# Altium schematic sheet Main_Cont_2.SchDoc
size A4; DocumentNumber: 16; SheetNumber: 16; SheetTotal: 28
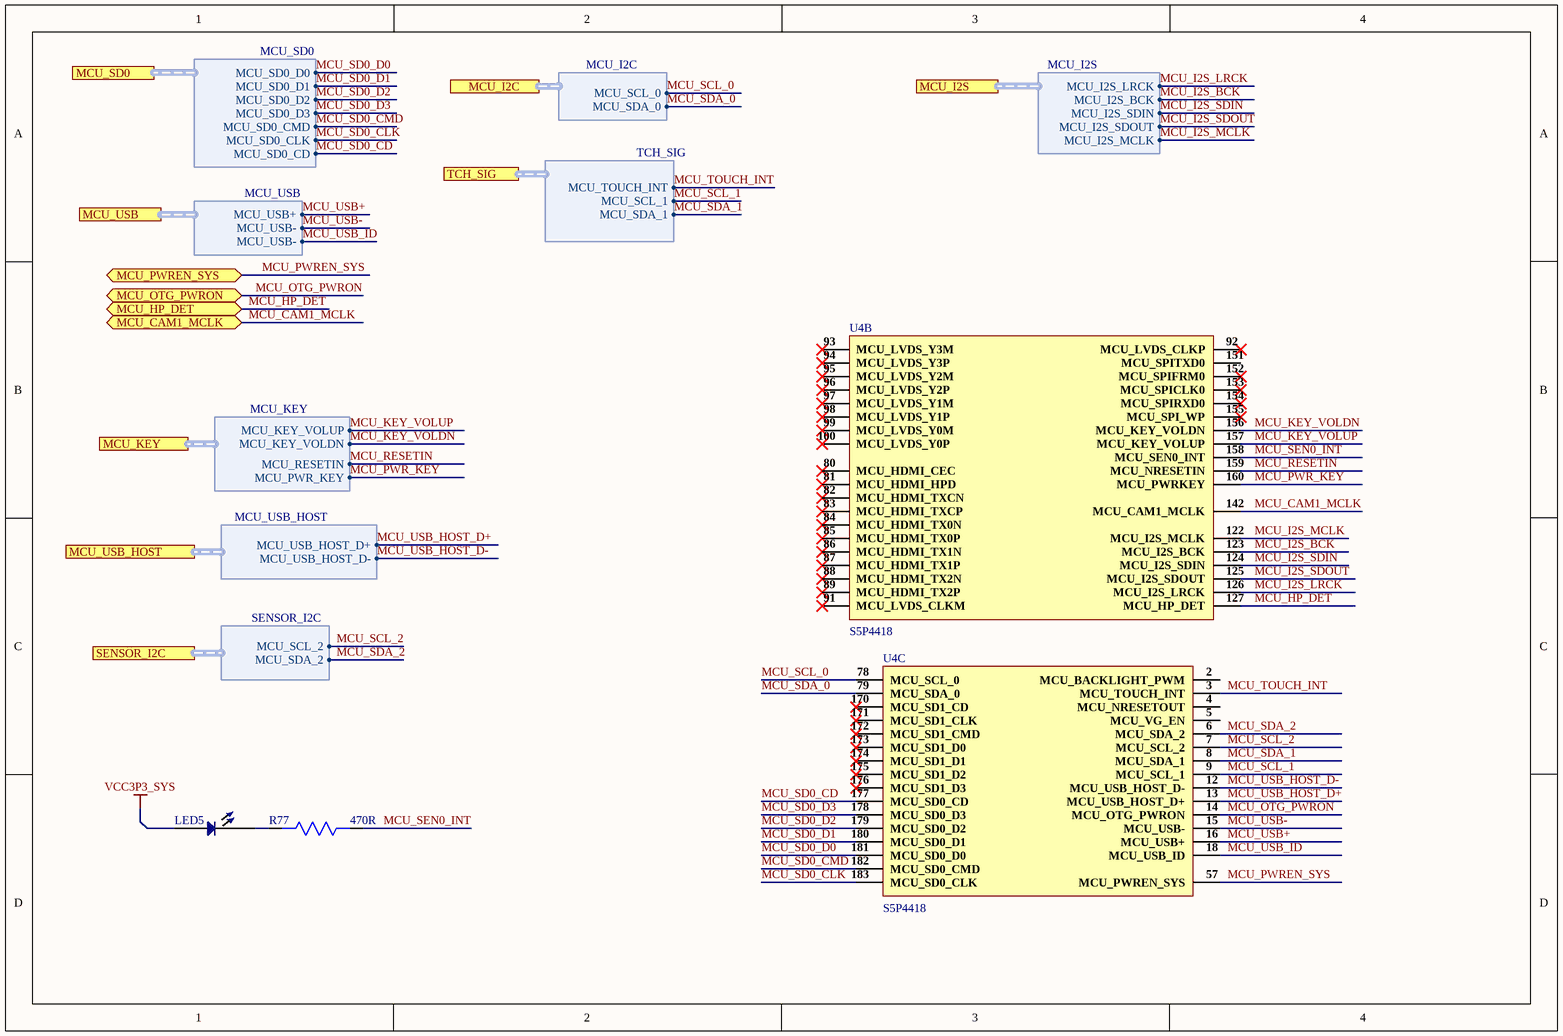
[diagram p0: Main_Cont_2.SchDoc]

## Parts
LED5  LED Blue  [LED 0402]  (value not drawn)
R77  470R  [Res0603]
U4  S5P4418  [S5P4418]  (parts B,C of 6)

## Ports
MCU_CAM1_MCLK (bidir), MCU_HP_DET (bidir), MCU_I2C (harness MCU_I2C), MCU_I2S (harness MCU_I2S), MCU_KEY (harness MCU_KEY), MCU_OTG_PWRON (bidir), MCU_PWREN_SYS (bidir), MCU_SD0 (harness MCU_SD0), MCU_USB (harness MCU_USB), MCU_USB_HOST (harness MCU_USB_HOST), SENSOR_I2C (harness SENSOR_I2C), TCH_SIG (harness TCH_SIG)

## Harnesses
MCU_I2S: MCU_I2S_LRCK, MCU_I2S_BCK, MCU_I2S_SDIN, MCU_I2S_SDOUT, MCU_I2S_MCLK
MCU_I2C: MCU_SCL_0, MCU_SDA_0
MCU_KEY: MCU_KEY_VOLUP, MCU_KEY_VOLDN, MCU_RESETIN, MCU_PWR_KEY
MCU_USB_HOST: MCU_USB_HOST_D+, MCU_USB_HOST_D-
TCH_SIG: MCU_TOUCH_INT, MCU_SCL_1, MCU_SDA_1
MCU_SD0: MCU_SD0_D0, MCU_SD0_D1, MCU_SD0_D2, MCU_SD0_D3, MCU_SD0_CMD, MCU_SD0_CLK, MCU_SD0_CD
MCU_USB: MCU_USB+, MCU_USB-, MCU_USB-
SENSOR_I2C: MCU_SCL_2, MCU_SDA_2

## Nets
VCC3P3_SYS: LED5.1
MCU_CAM1_MCLK: U4.142(MCU_CAM1_MCLK) ; port MCU_CAM1_MCLK
MCU_HP_DET: U4.127(MCU_HP_DET) ; port MCU_HP_DET
MCU_I2S_BCK: U4.123(MCU_I2S_BCK) ; port MCU_I2S.MCU_I2S_BCK
MCU_I2S_LRCK: U4.126(MCU_I2S_LRCK) ; port MCU_I2S.MCU_I2S_LRCK
MCU_I2S_MCLK: U4.122(MCU_I2S_MCLK) ; port MCU_I2S.MCU_I2S_MCLK
MCU_I2S_SDIN: U4.124(MCU_I2S_SDIN) ; port MCU_I2S.MCU_I2S_SDIN
MCU_I2S_SDOUT: U4.125(MCU_I2S_SDOUT) ; port MCU_I2S.MCU_I2S_SDOUT
MCU_KEY_VOLDN: U4.156(MCU_KEY_VOLDN) ; port MCU_KEY.MCU_KEY_VOLDN
MCU_KEY_VOLUP: U4.157(MCU_KEY_VOLUP) ; port MCU_KEY.MCU_KEY_VOLUP
MCU_OTG_PWRON: U4.14(MCU_OTG_PWRON) ; port MCU_OTG_PWRON
MCU_PWR_KEY: U4.160(MCU_PWRKEY) ; port MCU_KEY.MCU_PWR_KEY
MCU_PWREN_SYS: U4.57(MCU_PWREN_SYS) ; port MCU_PWREN_SYS
MCU_RESETIN: U4.159(MCU_NRESETIN) ; port MCU_KEY.MCU_RESETIN
MCU_SCL_0: U4.78(MCU_SCL_0) ; port MCU_I2C.MCU_SCL_0
MCU_SCL_1: U4.9(MCU_SCL_1) ; port TCH_SIG.MCU_SCL_1
MCU_SCL_2: U4.7(MCU_SCL_2) ; port SENSOR_I2C.MCU_SCL_2
MCU_SD0_CD: U4.177(MCU_SD0_CD) ; port MCU_SD0.MCU_SD0_CD
MCU_SD0_CLK: U4.183(MCU_SD0_CLK) ; port MCU_SD0.MCU_SD0_CLK
MCU_SD0_CMD: U4.182(MCU_SD0_CMD) ; port MCU_SD0.MCU_SD0_CMD
MCU_SD0_D0: U4.181(MCU_SD0_D0) ; port MCU_SD0.MCU_SD0_D0
MCU_SD0_D1: U4.180(MCU_SD0_D1) ; port MCU_SD0.MCU_SD0_D1
MCU_SD0_D2: U4.179(MCU_SD0_D2) ; port MCU_SD0.MCU_SD0_D2
MCU_SD0_D3: U4.178(MCU_SD0_D3) ; port MCU_SD0.MCU_SD0_D3
MCU_SDA_0: U4.79(MCU_SDA_0) ; port MCU_I2C.MCU_SDA_0
MCU_SDA_1: U4.8(MCU_SDA_1) ; port TCH_SIG.MCU_SDA_1
MCU_SDA_2: U4.6(MCU_SDA_2) ; port SENSOR_I2C.MCU_SDA_2
MCU_SEN0_INT: R77.1 U4.158(MCU_SEN0_INT)
MCU_TOUCH_INT: U4.3(MCU_TOUCH_INT) ; port TCH_SIG.MCU_TOUCH_INT
MCU_USB+: U4.16(MCU_USB+) ; port MCU_USB.MCU_USB+
MCU_USB-: U4.15(MCU_USB-) U4.18(MCU_USB_ID) ; port MCU_USB.MCU_USB-  [also labelled MCU_USB_ID]
MCU_USB_HOST_D+: U4.13(MCU_USB_HOST_D+) ; port MCU_USB_HOST.MCU_USB_HOST_D+
MCU_USB_HOST_D-: U4.12(MCU_USB_HOST_D-) ; port MCU_USB_HOST.MCU_USB_HOST_D-
NetLED5_2: LED5.2 R77.2

Not connected (* = marked no-connect by the designer): U4 2(MCU_BACKLIGHT_PWM) 4(MCU_NRESETOUT) 5(MCU_VG_EN) 80(MCU_HDMI_CEC)* 81(MCU_HDMI_HPD)* 82(MCU_HDMI_TXCN)* 83(MCU_HDMI_TXCP)* 84(MCU_HDMI_TX0N)* 85(MCU_HDMI_TX0P)* 86(MCU_HDMI_TX1N)* 87(MCU_HDMI_TX1P)* 88(MCU_HDMI_TX2N)* 89(MCU_HDMI_TX2P)* 91(MCU_LVDS_CLKM)* 92(MCU_LVDS_CLKP)* 93(MCU_LVDS_Y3M)* 94(MCU_LVDS_Y3P)* 95(MCU_LVDS_Y2M)* 96(MCU_LVDS_Y2P)* 97(MCU_LVDS_Y1M)* 98(MCU_LVDS_Y1P)* 99(MCU_LVDS_Y0M)* 100(MCU_LVDS_Y0P)* 151(MCU_SPITXD0) 152(MCU_SPIFRM0)* 153(MCU_SPICLK0)* 154(MCU_SPIRXD0)* 155(MCU_SPI_WP)* 170(MCU_SD1_CD)* 171(MCU_SD1_CLK)* 172(MCU_SD1_CMD)* 173(MCU_SD1_D0)* 174(MCU_SD1_D1)* 175(MCU_SD1_D2)* 176(MCU_SD1_D3)*

## Library data of the parts
LED5 = APHHS1005QBC/D: LED BLUE CLEAR CHIP SMD 0402; Manufacturer: Kingbright; Lens Colour: Colorless; Forward Current: 20mA; Forward Voltage: 3.3V; Power Rating: 120mW; Luminous Intensity: 60mcd; Viewing Angle: 120°; Dominant Wavelength: 465nm; Supplier 1: Digi-Key; Manufacturer Part Number: APHHS1005QBC/D; Stock 1: 57149; Pricing 1: 1=0.58, 10=0.42, 25=0.3432, 100=0.2746, 250=0.23168, 500=0.19734, 1000=0.15444 (USD); Mount: Surface Mount; Case/Package: 0402; Colour: Blue; Case Code (Metric): 1005; Case Code (Imperial): 0402; Min Operating Temperature: -40°C; Max Operating Temperature: 85°C; Package Quantity: 2000; Illumination Colour: Blue; Packaging: Tape and Reel; Lens Style: Clear; Lens Transparency: Clear; Test Current: 20mA; Length: 1mm; Height: 0.6mm; Width: 0.5mm; Lead Free: Lead Free; ComponentLink1URL: http://www.mouser.com/ds/2/216/APHHS1005QBC-D-54846.pdf; ComponentLink1Description: http://www.mouser.com/ds/2/216/APHHS1005QBC-D-54846.pdf; ComponentLink2URL: http://www.kingbrightusa.com/images/catalog/SPEC/APHHS1005QBC-D.pdf; ComponentLink2Description: http://www.kingbrightusa.com/images/catalog/SPEC/APHHS1005QBC-D.pdf; Supplier Part Number 1: 754-1504-1-ND
R77 = RC0603FR-07470RL: RES SMD 470 OHM 1% 1/10W 0603; Manufacturer: Yageo; Power Rating: 100mW; Voltage Rating: 50V; Temperature Coefficient: 100ppm/°C; Working Voltage: 75V; Supplier 1: Digi-Key; Manufacturer Part Number: RC0603FR-07470RL; Stock 1: 4530601; Pricing 1: 1=0.1, 10=0.023, 100=0.0094, 1000=0.00421, 2500=0.00366 (USD); Case/Package: 0603; Case Code (Metric): 1608; Case Code (Imperial): 0603; Min Operating Temperature: -55°C; Max Operating Temperature: 155°C; Tolerance: 1%; Resistance: 470R; Packaging: Tape and Reel; Package Quantity: 1; Composition: Thick Film; Number of Terminations: 2; Termination: SMD/SMT; Military Standard: Not; Max Power Dissipation: 100mW; Features: Moisture Resistant; Length: 1.6mm; Height: 0.022inch; Width: 0.031inch; Depth: 0.8mm; REACH SVHC: No SVHC; Lead Free: Lead Free; ComponentLink1URL: http://documents.rs-components.com/techlib://itc_doclist_GB.htm?stockno=5047341&src-supplier=RSComponents; ComponentLink1Description: http://documents.rs-components.com/techlib://itc_doclist_GB.htm?stockno=5047341&src-supplier=RSComponents; ComponentLink2URL: http://www.farnell.com/datasheets/1868787.pdf?src-supplier=Element14; ComponentLink2Description: http://www.farnell.com/datasheets/1868787.pdf?src-supplier=Element14; ComponentLink3URL: http://www.farnell.com/datasheets/2167052.pdf?src-supplier=Element14; ComponentLink3Description: http://www.farnell.com/datasheets/2167052.pdf?src-supplier=Element14; ComponentLink4URL: http://www.yageo.com/documents/recent/PYu-RC_Group_51_RoHS_L_10.pdf?src-supplier=Digi-Key; ComponentLink4Description: http://www.yageo.com/documents/recent/PYu-RC_Group_51_RoHS_L_10.pdf?src-supplier=Digi-Key; Supplier Part Number 1: 311-470HRCT-ND
U4 = S5P4418: S5P4418 Quad Core Android SoM System on Module; Manufacturer: Samsung; Value: Custom; Manufacturer Part No: S5P4418; Package: Custom